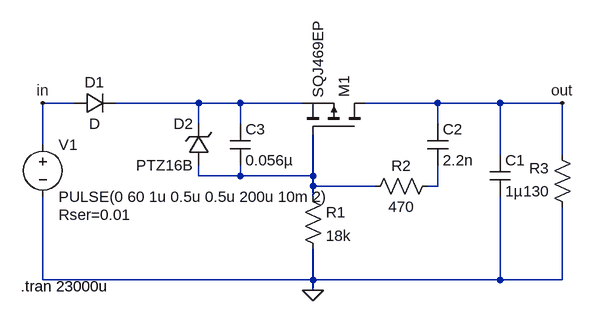
[diagram p0: schematic inrush_current_limiter2.asc]
inrush_current_limiter2.asc, the LTspice schematic file:
Version 4
SHEET 1 880 680
WIRE -208 16 -256 16
WIRE -16 16 -144 16
WIRE 48 16 -16 16
WIRE 144 16 48 16
WIRE 352 16 240 16
WIRE 448 16 352 16
WIRE 544 16 448 16
WIRE -16 48 -16 16
WIRE 48 48 48 16
WIRE 352 48 352 16
WIRE -256 80 -256 16
WIRE 448 96 448 16
WIRE 544 96 544 16
WIRE -16 128 -16 112
WIRE 48 128 48 112
WIRE 48 128 -16 128
WIRE 160 128 160 64
WIRE 160 128 48 128
WIRE 160 144 160 128
WIRE 256 144 160 144
WIRE 352 144 352 112
WIRE 352 144 336 144
WIRE 160 160 160 144
WIRE -256 288 -256 160
WIRE 160 288 160 240
WIRE 160 288 -256 288
WIRE 448 288 448 160
WIRE 448 288 160 288
WIRE 544 288 544 176
WIRE 544 288 448 288
WIRE 160 304 160 288
FLAG 160 304 0
FLAG -256 16 in
FLAG 544 16 out
SYMBOL pmos 240 64 M270
SYMATTR InstName M1
SYMATTR Value SQJ469EP
SYMBOL res 144 144 R0
SYMATTR InstName R1
SYMATTR Value 18k
SYMBOL res 352 128 R90
WINDOW 0 0 56 VBottom 2
WINDOW 3 32 56 VTop 2
SYMATTR InstName R2
SYMATTR Value 470
SYMBOL res 560 192 R180
WINDOW 0 36 76 Left 2
WINDOW 3 36 40 Left 2
SYMATTR InstName R3
SYMATTR Value 130
SYMBOL cap 432 96 R0
SYMATTR InstName C1
SYMATTR Value 1µ
SYMATTR SpiceLine Rser=0.05
SYMBOL cap 336 48 R0
SYMATTR InstName C2
SYMATTR Value 2.2n
SYMATTR SpiceLine Rser=0.01
SYMBOL cap 32 48 R0
SYMATTR InstName C3
SYMATTR Value 0.056µ
SYMATTR SpiceLine Rser=0.01
SYMBOL zener 0 112 R180
WINDOW 0 24 64 Left 2
WINDOW 3 24 0 Left 2
SYMATTR InstName D2
SYMATTR Value PTZ16B
SYMBOL voltage -256 64 R0
WINDOW 123 0 0 Left 2
WINDOW 39 24 124 Left 2
SYMATTR InstName V1
SYMATTR Value PULSE(0 60 1u 0.5u 0.5u 200u 10m 2)
SYMATTR SpiceLine Rser=0.01
SYMBOL diode -208 32 R270
WINDOW 0 32 32 VTop 2
WINDOW 3 0 32 VBottom 2
SYMATTR InstName D1
TEXT -290 298 Left 2 !.tran 23000u

The netlist it stands for:
* inrush_current_limiter2.asc
M1 out N002 N001 N001 SQJ469EP
R1 N002 0 18k
R2 N003 N002 470
R3 0 out 130
C1 out 0 1µ Rser=0.05
C2 out N003 2.2n Rser=0.01
C3 N001 N002 0.056µ Rser=0.01
D2 N002 N001 PTZ16B
V1 in 0 PULSE(0 60 1u 0.5u 0.5u 200u 10m 2) Rser=0.01
D1 in N001 D
.model D D
.lib standard.dio
.model NMOS NMOS
.model PMOS PMOS
.lib standard.mos
.tran 23000u
.backanno
.end